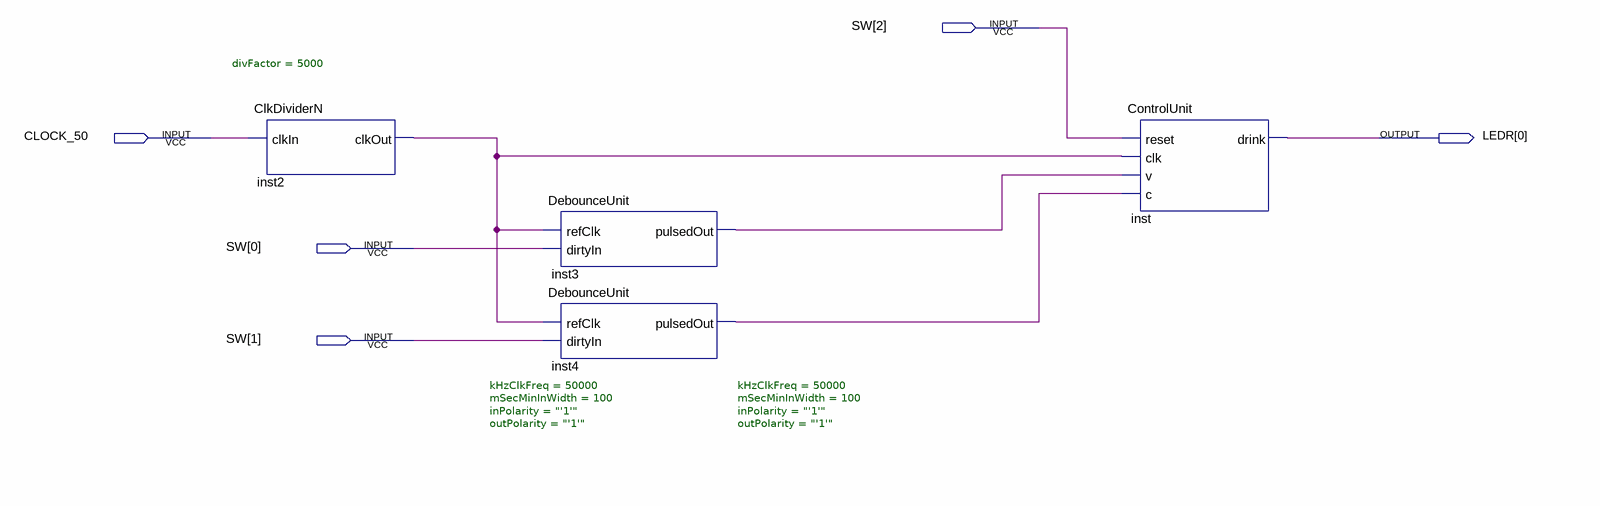
[diagram p0: schematic sheet]
// Quartus schematic DrinkMachine.bdf as structural Verilog: 4 symbols, 5 pins
module DrinkMachine (
  input  [2:0] SW,
  input  CLOCK_50,
  output [0:0] LEDR
);

  wire inst2_clkout, inst3_pulsedout, inst4_pulsedout;

  ClkDividerN #(.divFactor(5000)) inst2 (.clkIn(CLOCK_50), .clkOut(inst2_clkout));
  DebounceUnit #(.kHzClkFreq(50000), .mSecMinInWidth(100), .inPolarity("'1'"), .outPolarity("'1'")) inst3 (
    .refClk(inst2_clkout), .dirtyIn(SW[0]), .pulsedOut(inst3_pulsedout));
  DebounceUnit #(.kHzClkFreq(50000), .mSecMinInWidth(100), .inPolarity("'1'"), .outPolarity("'1'")) inst4 (
    .refClk(inst2_clkout), .dirtyIn(SW[1]), .pulsedOut(inst4_pulsedout));
  ControlUnit inst (.reset(SW[2]), .clk(inst2_clkout), .v(inst3_pulsedout), .c(inst4_pulsedout), .drink(LEDR[0]));
endmodule
